# Altium project Orion_Board.PrjPcb
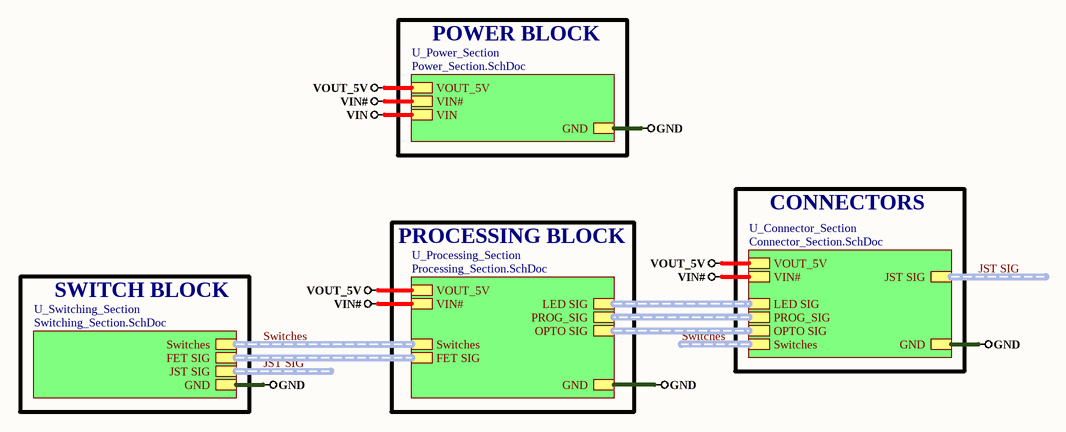
[diagram p0: Top_Sheet.SchDoc]
5 sheets, 64 parts. Net scope: hierarchical (ports join the sheet entries above them; power ports are global).
Board file: Orion_PCB.PcbDoc
Sheets:
  Top_Sheet.SchDoc
    U_Connector_Section = Connector_Section.SchDoc
    U_Processing_Section = Processing_Section.SchDoc
    U_Switching_Section = Switching_Section.SchDoc
    U_Power_Section = Power_Section.SchDoc

## Sheet Top_Sheet.SchDoc
size A4; DocumentNumber: 1; SheetNumber: 1; SheetTotal: 5

### Sub-sheets
U_Connector_Section = Connector_Section.SchDoc: VOUT_5V, GND, VIN#, PROG_SIG (harness PROG_SIG), LED SIG (harness LED SIG), Switches (harness Switches), OPTO SIG (harness OPTO SIG), JST SIG (harness JST SIG)
U_Power_Section = Power_Section.SchDoc: VOUT_5V, GND, VIN#, VIN
U_Processing_Section = Processing_Section.SchDoc: Switches (harness Switches), LED SIG (harness LED SIG), PROG_SIG (harness PROG_SIG), VOUT_5V, VIN#, FET SIG (harness FET SIG), OPTO SIG (harness OPTO SIG), GND
U_Switching_Section = Switching_Section.SchDoc: FET SIG (harness FET SIG), Switches (harness Switches), GND, JST SIG (harness JST SIG)

### Nets
GND: sheet U_Connector_Section/GND, sheet U_Processing_Section/GND, sheet U_Switching_Section/GND, sheet U_Power_Section/GND
VIN#: sheet U_Connector_Section/VIN#, sheet U_Processing_Section/VIN#, sheet U_Power_Section/VIN#
VOUT_5V: sheet U_Connector_Section/VOUT_5V, sheet U_Processing_Section/VOUT_5V, sheet U_Power_Section/VOUT_5V

### Buses and harness runs
harness JST SIG = sheet U_Connector_Section/JST SIG
harness JST SIG = sheet U_Switching_Section/JST SIG
harness sheet U_Connector_Section/LED SIG = sheet U_Processing_Section/LED SIG
harness sheet U_Connector_Section/OPTO SIG = sheet U_Processing_Section/OPTO SIG
harness sheet U_Connector_Section/PROG_SIG = sheet U_Processing_Section/PROG_SIG
harness sheet U_Processing_Section/FET SIG = sheet U_Switching_Section/FET SIG
harness Switches = sheet U_Connector_Section/Switches
harness Switches = sheet U_Processing_Section/Switches = sheet U_Switching_Section/Switches

### Notes on the sheet
- POWER BLOCK
- CONNECTORS
- PROCESSING BLOCK
- SWITCH BLOCK

## Sheet Connector_Section.SchDoc
size A4; DocumentNumber: 5; SheetNumber: 5; SheetTotal: 5
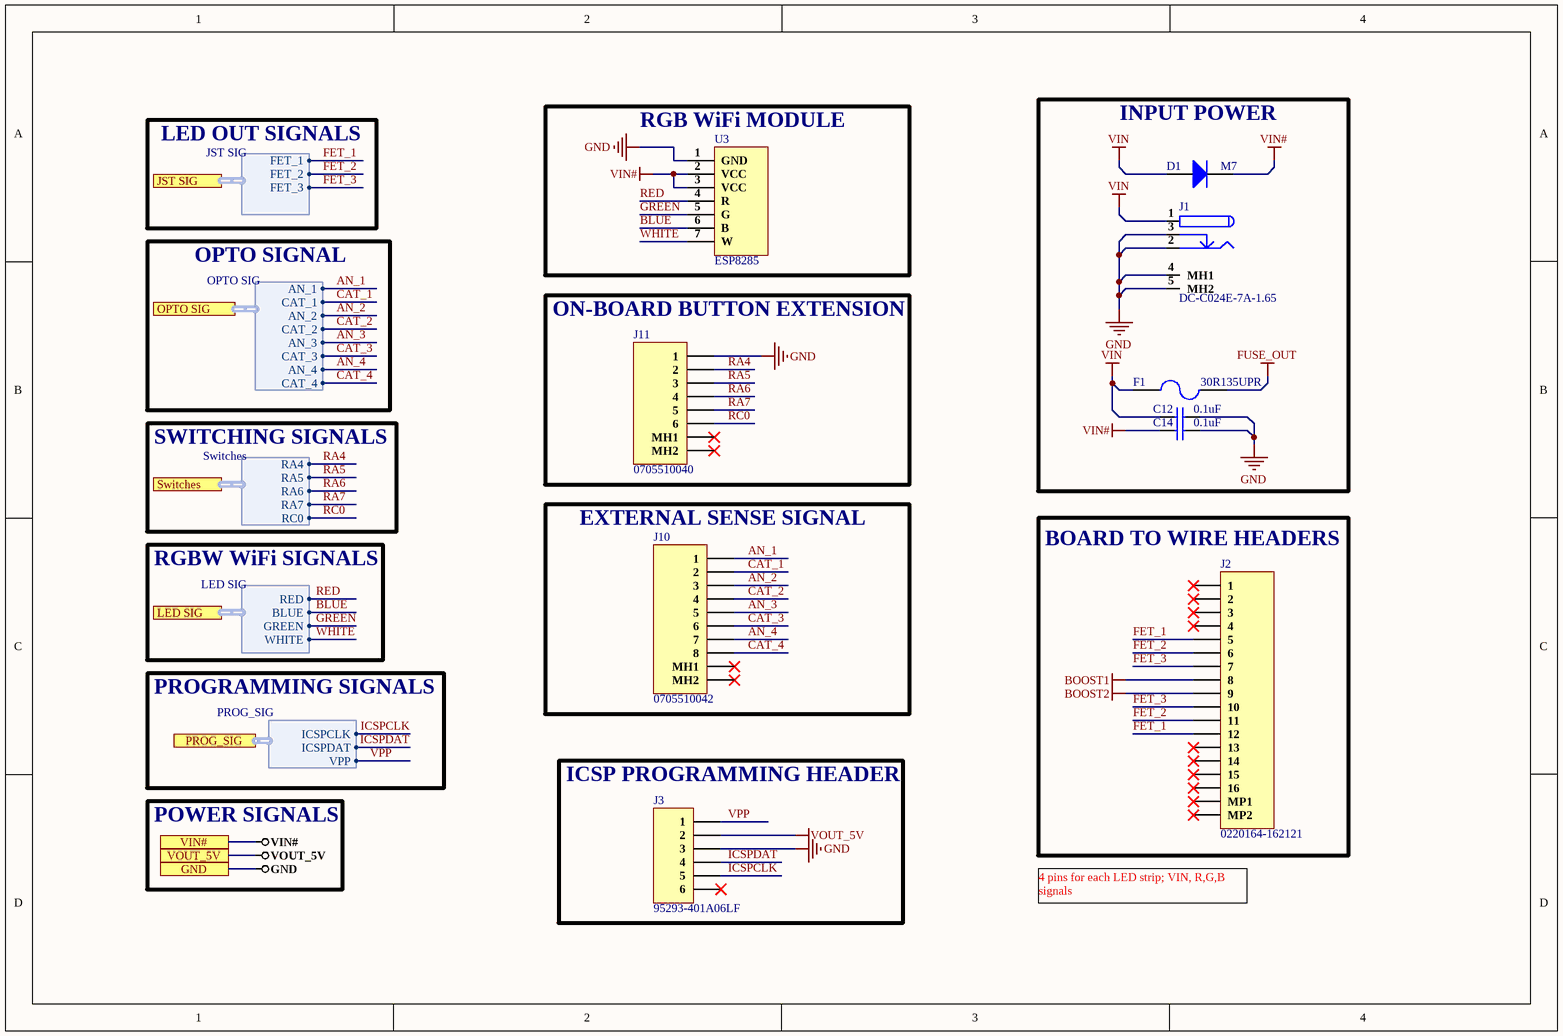
[diagram p1: Connector_Section.SchDoc]

### Parts
C12  0.1uF  [Cap0402]
C14  0.1uF  [Cap0402]
D1  M7  [SMA]
F1  30R135UPR  [30R135UPR]
J1  DC-C024E-7A-1.65  [DC-C024E-7A-1.65]
J2  0220164-162121  [0220164-162121]
J3  95293-401A06LF  [95293-401A06LF]
J10  0705510042  [0705510042]
J11  0705510040  [0705510040]
U3  ESP8285  [ESP8285]

### Blocks framed on the sheet
RGB WiFi MODULE: U3
INPUT POWER: C12 C14 D1 F1 J1
ON-BOARD BUTTON EXTENSION: J11
EXTERNAL SENSE SIGNAL: J10
BOARD TO WIRE HEADERS: J2
ICSP PROGRAMMING HEADER: J3

### Ports
GND, JST SIG (harness JST SIG), LED SIG (harness LED SIG), OPTO SIG (harness OPTO SIG), PROG_SIG (harness PROG_SIG), Switches (harness Switches), VIN#, VOUT_5V

### Harnesses
PROG_SIG: ICSPCLK, ICSPDAT, VPP
LED SIG: RED, BLUE, GREEN, WHITE
Switches: RA4, RA5, RA6, RA7, RC0
OPTO SIG: AN_1, CAT_1, AN_2, AN_3, AN_4, CAT_2, CAT_3, CAT_4
JST SIG: FET_1, FET_2, FET_3

### Nets
BOOST1: J2.8
BOOST2: J2.9
FUSE_OUT: F1.2
GND: C12.2 C14.2 J1.2 J1.3 J1.4(MH1) J1.5(MH2) J3.3 J11.1 U3.1(GND) ; port GND
VIN: C12.1 D1.1(A) F1.1 J1.1
VIN#: C14.1 D1.2(K) U3.2(VCC) U3.3(VCC) ; port VIN#
VOUT_5V: J3.2 ; port VOUT_5V
AN_1: J10.1 ; port OPTO SIG.AN_1
AN_2: J10.3 ; port OPTO SIG.AN_2
AN_3: J10.5 ; port OPTO SIG.AN_3
AN_4: J10.7 ; port OPTO SIG.AN_4
BLUE: U3.6(B) ; port LED SIG.BLUE
CAT_1: J10.2 ; port OPTO SIG.CAT_1
CAT_2: J10.4 ; port OPTO SIG.CAT_2
CAT_3: J10.6 ; port OPTO SIG.CAT_3
CAT_4: J10.8 ; port OPTO SIG.CAT_4
FET_1: J2.5 J2.12 ; port JST SIG.FET_1
FET_2: J2.6 J2.11 ; port JST SIG.FET_2
FET_3: J2.7 J2.10 ; port JST SIG.FET_3
GREEN: U3.5(G) ; port LED SIG.GREEN
ICSPCLK: J3.5 ; port PROG_SIG.ICSPCLK
ICSPDAT: J3.4 ; port PROG_SIG.ICSPDAT
RA4: J11.2 ; port Switches.RA4
RA5: J11.3 ; port Switches.RA5
RA6: J11.4 ; port Switches.RA6
RA7: J11.5 ; port Switches.RA7
RC0: J11.6 ; port Switches.RC0
RED: U3.4(R) ; port LED SIG.RED
VPP: J3.1 ; port PROG_SIG.VPP
WHITE: U3.7(W) ; port LED SIG.WHITE

Not connected (* = marked no-connect by the designer): J2 1* 2* 3* 4* 13* 14* 15* 16* MP1* MP2*; J3 6*; J10 MH1* MH2*; J11 MH1* MH2*

### Notes on the sheet
- LED OUT SIGNALS
- OPTO SIGNAL
- SWITCHING SIGNALS
- RGBW WiFi SIGNALS
- PROGRAMMING SIGNALS
- POWER SIGNALS
- 4 pins for each LED strip; VIN, R,G,B signals

### Library data of the parts
C12 C14 = C1005X5R1H104K050BB: CAP CER 0.1UF 50V X5R 0402; Manufacturer: TDK; Dielectric Material: Ceramic; Capacitance: 100nF; Tolerance: 10%; Supplier 1: Digi-Key; Manufacturer Part Number: C1005X5R1H104K050BB; Stock 1: 1455182; Pricing 1: 1=0.12, 10=0.09, 50=0.049, 100=0.04, 500=0.02858, 1000=0.02245, 2500=0.02041, 5000=0.01878 (USD); Mount: Surface Mount; Case/Package: 0402; Case Code (Metric): 1005; Case Code (Imperial): 0402; Weight: 2.3E-05oz; Min Operating Temperature: -55°C; Max Operating Temperature: 85°C; Dielectric: X5R; Voltage Rating: 50V; Packaging: Tape and Reel; Voltage Rating (DC): 50V; Termination: SMD/SMT; Construction: Flat; Package Quantity: 1; Resistor Type: Ceramic; Voltage: 50V; Series: C; Length: 1mm; Width: 0.02inch; Height: 0.5mm; Depth: 0.5mm; Thickness: 0.022inch; Radiation Hardening: No; Lead Free: Lead Free; REACH SVHC: No SVHC; RoHS Compliant: Yes; ComponentLink1URL: https://product.tdk.com/info/en/catalog/spec/mlccspec_commercial_general_midvoltage_en.pdf?src-supplier=Digi-Key; ComponentLink1Description: https://product.tdk.com/info/en/catalog/spec/mlccspec_commercial_general_midvoltage_en.pdf?src-supplier=Digi-Key; ComponentLink2URL: http://www.tdk.co.jp/tefe02/e413_c.pdf?src-supplier=Future+Electronics; ComponentLink2Description: http://www.tdk.co.jp/tefe02/e413_c.pdf?src-supplier=Future+Electronics; ComponentLink3URL: https://www.verical.com/server-webapp/html/getDatasheet?partID=743571&src-supplier=Verical; ComponentLink3Description: https://www.verical.com/server-webapp/html/getDatasheet?partID=743571&src-supplier=Verical; ComponentLink4URL: http://www.tdk.co.jp/tefe02/e412_c.pdf?src-supplier=Avnet+Europe; ComponentLink4Description: http://www.tdk.co.jp/tefe02/e412_c.pdf?src-supplier=Avnet+Europe; Supplier Part Number 1: 445-5942-1-ND
D1 = M7: 1A 5μA 1kV 1kV 1.1V 1A SMA(DO-214AC) Diodes - General Purpose ROHS; Manufacturer: Slkor; Value: Custom; Manufacturer Part No: M7; Package: SMA; ComponentLink1Description: LCSC; ComponentLink1URL: https://lcsc.com/product-detail/Diodes-General-Purpose_Slkor-SLKORMICRO-Elec-M7_C426571.html
F1 = 30R135UPR: PTC RESET FUSE 30V 1.35A RADIAL; Manufacturer: Littelfuse; Current Rating: 40A; Resistance: 130mR; Power Dissipation: 800mW; Trip Current: 2.7A; Time to Trip: 7.3s; Approvals: cULus,TUV; Supplier 1: Mouser; Manufacturer Part Number: 30R135UPR; RoHS: Yes; Category: PTC Resettable Fuses; Stock 1: 4973; Pricing 1: 1=0.53000, 10=0.42700, 50=0.42700, 100=0.32300, 1000=0.24200, 10000=0.23100 (USD); Case/Package: Radial; Min Operating Temperature: -40°C; Max Operating Temperature: 85°C; Package Quantity: 2000; Packaging: Tape and Reel; Max Current Rating: 40A; Termination: Radial; Max Voltage Rating (DC): 30V; Hold Current: 1.35A; Series: POLY-FUSE®, 30R; Width: 8.89mm; Height: 13.5mm; Lead Pitch: 5.1mm; Thickness: 3.05mm; Lead Free: Lead Free; RoHS Compliant: Yes; ComponentLink1URL: https://datasheet.ciiva.com/325/littelfuse-ptc-30r-325859.pdf?src-supplier=Digi-Key; ComponentLink1Description: https://datasheet.ciiva.com/325/littelfuse-ptc-30r-325859.pdf?src-supplier=Digi-Key; ComponentLink2URL: https://datasheet.ciiva.com/325/littelfuse-ptc-30r-325860.pdf?src-supplier=Digi-Key; ComponentLink2Description: https://datasheet.ciiva.com/325/littelfuse-ptc-30r-325860.pdf?src-supplier=Digi-Key; ComponentLink3URL: https://datasheet.ciiva.com/14119/gklittelfuse-30r-e-14119724.pdf?src-supplier=Distrelec; ComponentLink3Description: https://datasheet.ciiva.com/14119/gklittelfuse-30r-e-14119724.pdf?src-supplier=Distrelec; Supplier Part Number 1: 576-30R135UPR
J1 = DC-C024E-7A-1.65: DC Power Receptacle 1.65mm 4.3mm 7A 24V Plugin AC/DC Power Connectors ROHS; Manfacturer: XKB Connectivity; Maunfacturer Part No:: DC-C024E-7A-1.65; Package: Custom
J2 = 0220164-162121: 16 Pin Right angle JST Conn 2 mm Pitch; ComponentLink1Description: Datasheet; ComponentLink1URL: http://www.kaweei.com/indexdata/pic/2017072520595473499.pdf
J3 = 95293-401A06LF: CONN HEADER SMD 6POS 2.54MM; Manufacturer: Amphenol ICC / FCI; Number of Contacts: 6; Max Voltage Rating (AC): 1.5kV; Connector Type: Male Pin; Supplier 1: Digi-Key; Manufacturer Part Number: 95293-401A06LF; RoHS: Yes; Category: Headers and Wire Housings; Stock 1: 8979; Pricing 1: 1=3.32000, 10=3.01700, 100=2.65840 (USD); Mount: Surface Mount; Contact Plating: Tin; Color: Black; Contact Material: Bronze; Housing Color: Black; Housing Material: Thermoplastic; Min Operating Temperature: -65°C; Max Operating Temperature: 125°C; Number of Rows: 1; Termination: Solder; Package Quantity: 520; Packaging: Tape and Reel; Number of Positions: 6; Orientation: Straight; Series: BERGSTIK®, MezzSelect™, Basics+; Contact Type: Male Pin; Length: 15.24mm; Pitch: 2.54mm; Contact Mating Length: 0.23inch; Depth: 2.4mm; Radiation Hardening: No; Lead Free: Lead Free; RoHS Compliant: Yes; ComponentLink1URL: https://datasheet.ciiva.com/739/95293-739282.pdf?src-supplier=Digi-Key; ComponentLink1Description: https://datasheet.ciiva.com/739/95293-739282.pdf?src-supplier=Digi-Key; ComponentLink2URL: https://datasheet.ciiva.com/739/95293-739276.pdf?src-supplier=Digi-Key; ComponentLink2Description: https://datasheet.ciiva.com/739/95293-739276.pdf?src-supplier=Digi-Key; ComponentLink3URL: https://datasheet.ciiva.com/739/95293-739268.pdf?src-supplier=Digi-Key; ComponentLink3Description: https://datasheet.ciiva.com/739/95293-739268.pdf?src-supplier=Digi-Key; ComponentLink4URL: https://datasheet.ciiva.com/16733/95293-16733007.pdf?src-supplier=Avnet+Europe; ComponentLink4Description: https://datasheet.ciiva.com/16733/95293-16733007.pdf?src-supplier=Avnet+Europe; Supplier Part Number 1: 609-4398-1-ND
J10 = 0705510042: Conn Shrouded Header HDR 8 POS 2.54mm Solder RA Thru-Hole SL™ Tube; Manufacturer: Molex; Number of Positions: 8; Connector Type: Male Pin; Contact Resistance: 15mR; Pitch: 0.1inch; Supplier 1: Digi-Key; Manufacturer Part Number: 0705510042; RoHS: Yes; Category: Headers and Wire Housings; Pricing 1: 1=2.63000, 10=2.31400, 100=1.84100, 1000=1.52539, 5000=1.36759 (USD); Mount: Through Hole; Contact Plating: Gold; Color: Black; Housing Material: Polyester; Contact Material: Copper Alloy; Housing Color: Black; Min Operating Temperature: -40°C; Max Operating Temperature: 105°C; Number of Rows: 1; Packaging: Rail/Tube; Fastening Type: Latch; Termination: Solder; Orientation: Right Angle; Contact Mating Length: 0.24inch; Depth: 13.59mm; ComponentLink1URL: http://components.arrow.com/part/dataview/2934385S6164661N3303?src-supplier=Arrow+Electronics; ComponentLink1Description: http://components.arrow.com/part/dataview/2934385S6164661N3303?src-supplier=Arrow+Electronics; ComponentLink2URL: http://www.molex.com/pdm_docs/sd/705510001_sd.pdf?src-supplier=Digi-Key; ComponentLink2Description: http://www.molex.com/pdm_docs/sd/705510001_sd.pdf?src-supplier=Digi-Key; Supplier Part Number 1: WM20418-ND
J11 = 0705510040: CONN HEADER R/A 6POS 2.54MM; Manufacturer: Molex; Number of Positions: 6; Contact Resistance: 15mR; Connector Type: Male Pin; Supplier 1: Digi-Key; Manufacturer Part Number: 0705510040; RoHS: Yes; Category: Headers and Wire Housings; Stock 1: 1707; Pricing 1: 1=2.52000, 28=2.14929, 84=1.77560, 952=1.40175, 4900=1.24600 (USD); Mount: Through Hole; Contact Plating: Gold; Color: Black; Contact Material: Copper Alloy; Housing Material: Polyester; Housing Color: Black; Min Operating Temperature: -40°C; Max Operating Temperature: 105°C; Number of Rows: 1; Packaging: Rail/Tube; Termination: Solder; Number of Contacts: 6; Package Quantity: 1120; Fastening Type: Latch; Orientation: Right Angle; Pitch: 2.54mm; Contact Mating Length: 0.24inch; Depth: 13.59mm; Radiation Hardening: No; ComponentLink1URL: http://components.arrow.com/part/dataview/2934387S8722778N3303?src-supplier=Arrow+Electronics; ComponentLink1Description: http://components.arrow.com/part/dataview/2934387S8722778N3303?src-supplier=Arrow+Electronics; ComponentLink2URL: https://www.molex.com/pdm_docs/sd/705510001_sd.pdf?src-supplier=Digi-Key; ComponentLink2Description: https://www.molex.com/pdm_docs/sd/705510001_sd.pdf?src-supplier=Digi-Key; Supplier Part Number 1: WM21002-ND
U3 = ESP8285: DC5-24V Wireless WIFI LED RGB Controller RGBW Controller IR / RF Remote Control IOS/Android for LED Strip RGB RGBW RGBWW; Manufacturer: Tasmota; ComponentLink1Description: Supplier Link; ComponentLink1URL: https://tasmota.github.io/docs/devices/MagicHome-with-ESP8285/#; Manufacturer Part No: ESP8285; Package: Custom

## Sheet Processing_Section.SchDoc
size A4; DocumentNumber: 3; SheetNumber: 3; SheetTotal: 5
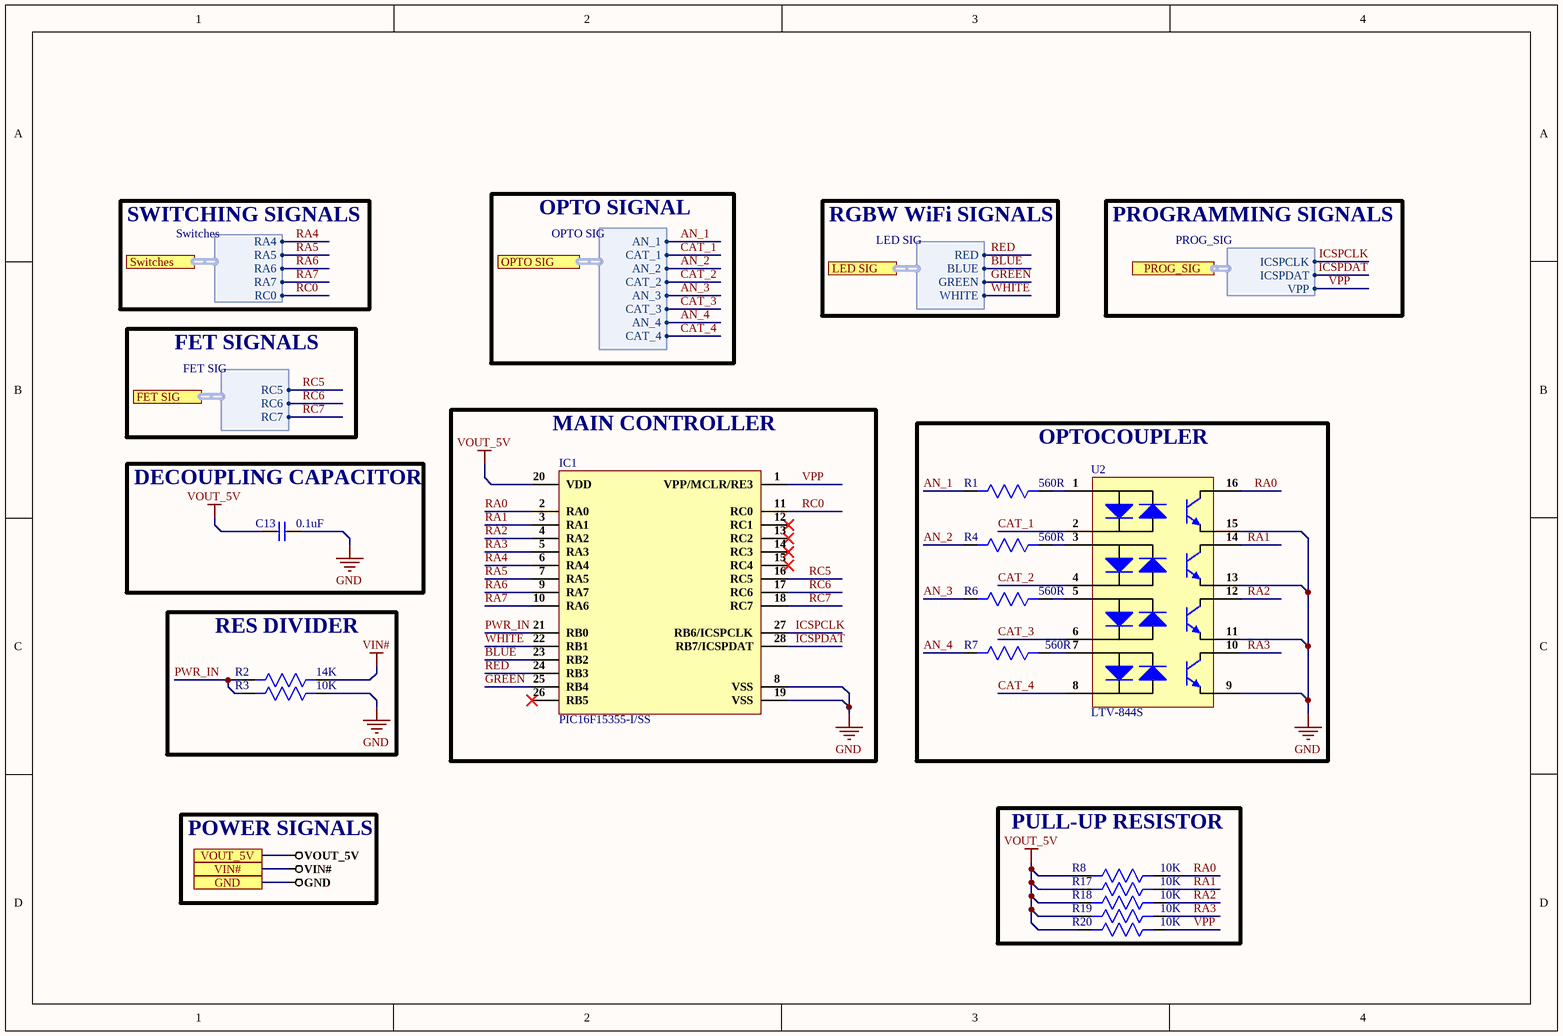
[diagram p2: Processing_Section.SchDoc]

### Parts
C13  0.1uF  [CAP 0201]
IC1  PIC16F15355-I/SS  [PIC16F15355-I/SS]
R1  560R  [RES 1210]
R2  14K  [Res0603]
R3  10K  [RES 0805]
R4  560R  [RES 1210]
R6  560R  [RES 1210]
R7  560R  [RES 1210]
R8  10K  [RES 0805]
R17  10K  [RES 0805]
R18  10K  [RES 0805]
R19  10K  [RES 0805]
R20  10K  [RES 0805]
U2  LTV-844S  [LTV-844S]

### Blocks framed on the sheet
MAIN CONTROLLER: IC1
OPTOCOUPLER: R1 R4 R6 R7 U2
DECOUPLING CAPACITOR: C13
RES DIVIDER: R2 R3
PULL-UP RESISTOR: R8 R17-R20

### Ports
FET SIG (harness FET SIG), GND, LED SIG (harness LED SIG), OPTO SIG (harness OPTO SIG), PROG_SIG (harness PROG_SIG), Switches (harness Switches), VIN#, VOUT_5V

### Harnesses
LED SIG: RED, BLUE, GREEN, WHITE
PROG_SIG: ICSPCLK, ICSPDAT, VPP
OPTO SIG: AN_1, CAT_1, AN_2, AN_3, AN_4, CAT_2, CAT_3, CAT_4
Switches: RA4, RA5, RA6, RA7, RC0
FET SIG: RC5, RC6, RC7

### Nets
GND: C13.2 IC1.8(VSS) IC1.19(VSS) R3.2 U2.9(E) U2.11(E) U2.13(E) U2.15(E) ; port GND
VIN#: R2.2 ; port VIN#
VOUT_5V: C13.1 IC1.20(VDD) R8.1 R17.1 R18.1 R19.1 R20.1 ; port VOUT_5V
AN_1: R1.1 ; port OPTO SIG.AN_1
AN_2: R4.1 ; port OPTO SIG.AN_2
AN_3: R6.1 ; port OPTO SIG.AN_3
AN_4: R7.1 ; port OPTO SIG.AN_4
BLUE: IC1.23(RB2) ; port LED SIG.BLUE
CAT_1: U2.2(K,A) ; port OPTO SIG.CAT_1
CAT_2: U2.4(K,A) ; port OPTO SIG.CAT_2
CAT_3: U2.6(K,A) ; port OPTO SIG.CAT_3
CAT_4: U2.8(K,A) ; port OPTO SIG.CAT_4
GREEN: IC1.25(RB4) ; port LED SIG.GREEN
ICSPCLK: IC1.27(RB6/ICSPCLK) ; port PROG_SIG.ICSPCLK
ICSPDAT: IC1.28(RB7/ICSPDAT) ; port PROG_SIG.ICSPDAT
PWR_IN: IC1.21(RB0) R2.1 R3.1
RA0: IC1.2(RA0) R8.2 U2.16(C)
RA1: IC1.3(RA1) R17.2 U2.14(C)
RA2: IC1.4(RA2) R18.2 U2.12(C)
RA3: IC1.5(RA3) R19.2 U2.10(C)
RA4: IC1.6(RA4) ; port Switches.RA4
RA5: IC1.7(RA5) ; port Switches.RA5
RA6: IC1.9(RA7) ; port Switches.RA6
RA7: IC1.10(RA6) ; port Switches.RA7
RC0: IC1.11(RC0) ; port Switches.RC0
RC5: IC1.16(RC5) ; port FET SIG.RC5
RC6: IC1.17(RC6) ; port FET SIG.RC6
RC7: IC1.18(RC7) ; port FET SIG.RC7
RED: IC1.24(RB3) ; port LED SIG.RED
VPP: IC1.1(VPP/MCLR/RE3) R20.2 ; port PROG_SIG.VPP
WHITE: IC1.22(RB1) ; port LED SIG.WHITE
NetR1_2: R1.2 U2.1(A,K)
NetR4_2: R4.2 U2.3(A,K)
NetR6_2: R6.2 U2.5(A,K)
NetR7_2: R7.2 U2.7(A,K)

Not connected (* = marked no-connect by the designer): IC1 12(RC1)* 13(RC2)* 14(RC3)* 15(RC4)* 26(RB5)*

### Notes on the sheet
- SWITCHING SIGNALS
- OPTO SIGNAL
- RGBW WiFi SIGNALS
- PROGRAMMING SIGNALS
- FET SIGNALS
- POWER SIGNALS

### Library data of the parts
C13 = GRM033R61E104KE14D: CAP CER 0.1UF 25V X5R 0201; Manufacturer: Murata; Capacitance: 100nF; Tolerance: 10%; Supplier 1: Mouser; Manufacturer Part Number: GRM033R61E104KE14D; RoHS: Yes; Category: Ceramic Capacitors; Stock 1: 19728; Pricing 1: 1=0.12000, 10=0.05600, 50=0.05600, 100=0.02500, 1000=0.01400, 10000=0.01100 (USD); Mount: Surface Mount; Case/Package: 0201; Case Code (Metric): 0603; Case Code (Imperial): 0201; Weight: 1.2E-05oz; Min Operating Temperature: -55°C; Max Operating Temperature: 85°C; Packaging: Tape and Reel; Voltage Rating: 25V; Dielectric: X5R; Termination: SMD/SMT; Resistor Type: Ceramic; Voltage Rating (DC): 25V; Package Quantity: 15000; Length: 0.024inch; Width: 0.012inch; Height: 0.3mm; Thickness: 0.013inch; Lead Free: Lead Free; RoHS Compliant: Yes; ComponentLink1URL: http://www.farnell.com/datasheets/2867843.pdf?src-supplier=Farnell; ComponentLink1Description: http://www.farnell.com/datasheets/2867843.pdf?src-supplier=Farnell; ComponentLink2URL: http://www.mouser.com/ds/2/281/c02e-2905.pdf?src-supplier=Mouser; ComponentLink2Description: http://www.mouser.com/ds/2/281/c02e-2905.pdf?src-supplier=Mouser; ComponentLink3URL: http://search.murata.co.jp/Ceramy/image/img/A01X/G101/ENG/GRM033R61E104KE14-01.pdf?src-supplier=Digi-Key; ComponentLink3Description: http://search.murata.co.jp/Ceramy/image/img/A01X/G101/ENG/GRM033R61E104KE14-01.pdf?src-supplier=Digi-Key; ComponentLink4URL: http://www.farnell.com/datasheets/2867843.pdf?src-supplier=Newark; ComponentLink4Description: http://www.farnell.com/datasheets/2867843.pdf?src-supplier=Newark; Supplier Part Number 1: 81-GRM033R61E104KE4D
IC1 = PIC16F15355-I/SS: IC MCU 8BIT 14KB FLASH 28SSOP; Manufacturer: Microchip; Interface: I2C,SPI,UART,USART; Peripherals: Brown-out Detect/Reset,POR,PWM,WDT; Core Architecture: PIC; Frequency: 32MHz; Number of I/Os: 25; Oscillator Type: Internal; Supplier 1: Digi-Key; Manufacturer Part Number: PIC16F15355-I/SS; RoHS: Yes; Category: Microcontrollers; Stock 1: 36; Pricing 1: 1=1.39000, 25=1.27640, 100=1.15500 (USD); Case/Package: SSOP; Min Operating Temperature: -40°C; Max Operating Temperature: 85°C; Memory Type: FLASH; Packaging: Rail/Tube; Memory Size: 14KB; RoHS Compliant: Yes; ComponentLink1URL: http://www.microchip.com/mymicrochip/filehandler.aspx?ddocname=en585524&src-supplier=Digi-Key; ComponentLink1Description: http://www.microchip.com/mymicrochip/filehandler.aspx?ddocname=en585524&src-supplier=Digi-Key; Supplier Part Number 1: PIC16F15355-I/SS-ND
R1 R4 R6 R7 = RC1210FR-07560RL: RES 560 OHM 1% 1/2W 1210; Manufacturer: Yageo; Power Rating: 500mW; Voltage Rating: 200V; Temperature Coefficient: 100ppm/°C; Supplier 1: Digi-Key; Manufacturer Part Number: RC1210FR-07560RL; RoHS: Yes; Category: Chip SMD Resistors; Pricing 1: 1=0.17000, 10=0.14900, 100=0.05740, 1000=0.02525, 2500=0.02181 (USD); Case/Package: 1210; Case Code (Imperial): 1210; Case Code (Metric): 3225; Size Code: 1210; Min Operating Temperature: -55°C; Max Operating Temperature: 155°C; Tolerance: 1%; Packaging: Tape and Reel; Resistance: 560R; Resistor Type: Thick Film; Termination: SMD/SMT; Number of Terminations: 2; Max Power Dissipation: 500mW; Features: Moisture Resistant; Series: RC; Construction: Rectangular; Length: 3.1mm; Width: 2.6mm; Height: 0.024inch; Depth: 2.6mm; Military Standard: Not; Lead Free: Lead Free; RoHS Compliant: Yes; ComponentLink1URL: https://datasheet.ciiva.com/12575/pyu-rc1210-51-rohs-l-4-12575621.pdf?src-supplier=Mouser; ComponentLink1Description: https://datasheet.ciiva.com/12575/pyu-rc1210-51-rohs-l-4-12575621.pdf?src-supplier=Mouser; Supplier Part Number 1: 13-RC1210FR-07560RLCT-ND
R2 = RT0603BRE0714KL: RES SMD 0603 14kOhm 0.1% Paper T/R; Manufacturer: Yageo; Resistance: 14kR; Power Rating: 100mW; Voltage Rating (DC): 50V; Temperature Coefficient: 50ppm/°C; Supplier 1: Digi-Key; Manufacturer Part Number: RT0603BRE0714KL; RoHS: Yes; Category: Chip SMD Resistors; Pricing 1: 5000=0.04543 (USD); Case/Package: 0603; Min Operating Temperature: -55°C; Max Operating Temperature: 155°C; Tolerance: 0.1%; Packaging: Tape and Reel; Resistor Type: Thin Film; Series: RT; Max Power Dissipation: 100mW; Number of Terminations: 2; Construction: Rectangular; Length: 1.6mm; Width: 800um; Depth: 0.8mm; Military Standard: Not; Lead Free: Lead Free; RoHS Compliant: Yes; ComponentLink1URL: http://components.arrow.com/part/dataview/0323_03292491?src-supplier=Arrow+Europe; ComponentLink1Description: http://components.arrow.com/part/dataview/0323_03292491?src-supplier=Arrow+Europe; ComponentLink2URL: http://www.yageo.com/documents/recent/PYu-RT_1-to-0.01_RoHS_L_9.pdf?src-supplier=Digi-Key; ComponentLink2Description: http://www.yageo.com/documents/recent/PYu-RT_1-to-0.01_RoHS_L_9.pdf?src-supplier=Digi-Key; Supplier Part Number 1: RT0603BRE0714KL-ND
R3 R8 R17-R20 = 0805W8F1002T5E: ±1% 1/8W Thick Film Resistors 150V ±100ppm/℃ -55℃~+155℃ 10kΩ 0805 Chip Resistor - Surface Mount ROHS; Manufacturer: UNI-ROYAL; Manufacturer Part No: 0805W8F1002T5E; Package: 0805; Value: 10kΩ
U2 = LTV-844S: OPTOISOLTR 5KV 4CH TRANS 16-SMD; Manufacturer: Vishay Lite-On; Forward Voltage: 1.4V; Number of Channels: 4; Collector Emitter Voltage (VCEO): 35V; Rise Time: 18000ns; Forward Current: 50mA; Collector Emitter Saturation Voltage: 200mV; Current Transfer Ratio: 300%; Max Power Dissipation: 200mW; Input Type: AC; Supplier 1: Future Electronics; Manufacturer Part Number: LTV-844S; RoHS: Yes; Category: Optocouplers; Stock 1: 1400; Pricing 1: 25=0.90500 (USD); Mount: Surface Mount; Case/Package: SMD/SMT; Number of Pins: 16; Min Operating Temperature: -30°C; Max Operating Temperature: 100°C; Packaging: Rail/Tube; Max Output Voltage: 35V; Output Current per Channel: 50mA; Fall Time: 18000ns; Number of Elements: 4; Power Dissipation: 200mW; Isolation Voltage: 5kV; Max Input Current: 50mA; Max Collector Current: 50mA; Package Quantity: 25; Series: -; Collector-emitter Voltage-Max: 200mV; Number of Circuits: 4; Output Voltage: 35V; Isolation Voltage-Max: 5kV; Radiation Hardening: No; RoHS Compliant: Yes; Lead Free: Lead Free; ComponentLink1URL: https://datasheet.ciiva.com/11772/0900766b80de6b5f-11772471.pdf?src-supplier=RSComponents; ComponentLink1Description: https://datasheet.ciiva.com/11772/0900766b80de6b5f-11772471.pdf?src-supplier=RSComponents; ComponentLink2URL: https://datasheet.ciiva.com/15118/getdatasheetpartid-141775-15118788.pdf?src-supplier=Verical; ComponentLink2Description: https://datasheet.ciiva.com/15118/getdatasheetpartid-141775-15118788.pdf?src-supplier=Verical; ComponentLink3URL: https://datasheet.ciiva.com/2086/s-110-ltv-814824844m-s-s-ta-s-ta1-s-tpseries-2086434.pdf?src-supplier=Digi-Key; ComponentLink3Description: https://datasheet.ciiva.com/2086/s-110-ltv-814824844m-s-s-ta-s-ta1-s-tpseries-2086434.pdf?src-supplier=Digi-Key; ComponentLink4URL: https://datasheet.ciiva.com/15957/ltv-8x4-15957686.pdf?src-supplier=Onlinecomponents.com; ComponentLink4Description: https://datasheet.ciiva.com/15957/ltv-8x4-15957686.pdf?src-supplier=Onlinecomponents.com; ComponentLink5URL: https://datasheet.ciiva.com/26923/getdatasheetpartid-757770-26923467.pdf?src-supplier=Verical; ComponentLink5Description: https://datasheet.ciiva.com/26923/getdatasheetpartid-757770-26923467.pdf?src-supplier=Verical; Supplier Part Number 1: 5600457

## Sheet Switching_Section.SchDoc
size A4; DocumentNumber: 4; SheetNumber: 4; SheetTotal: 5
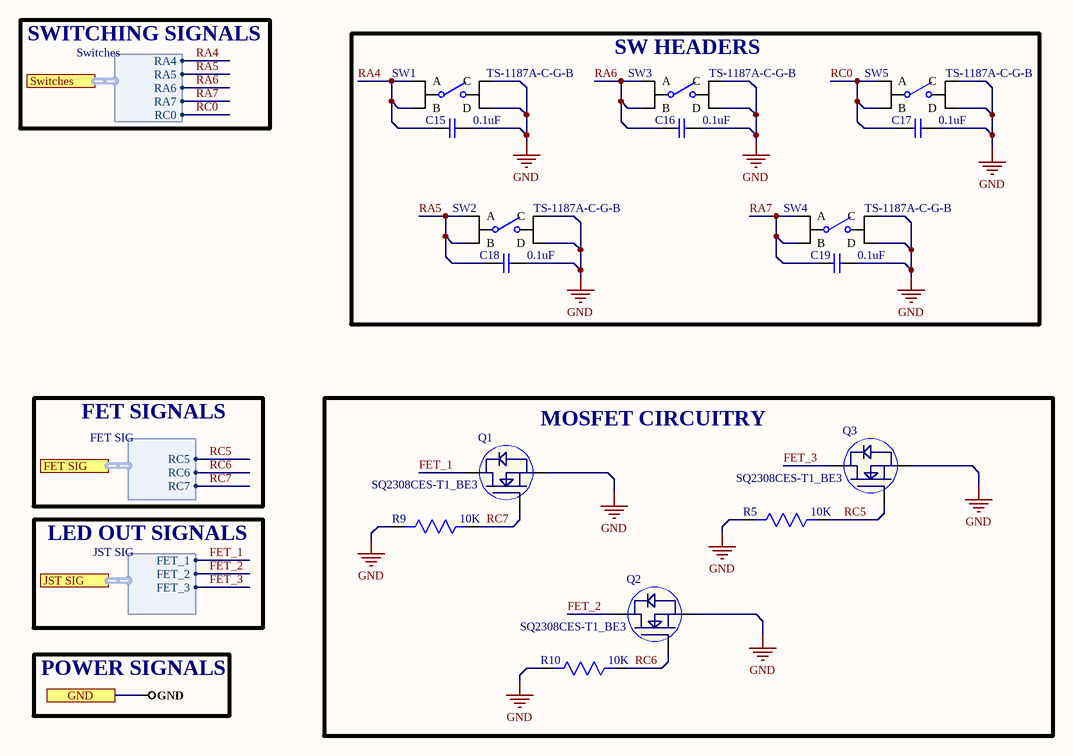
[diagram p3: Switching_Section.SchDoc]

### Parts
C15  0.1uF  [CAP 0201]
C16  0.1uF  [CAP 0201]
C17  0.1uF  [CAP 0201]
C18  0.1uF  [CAP 0201]
C19  0.1uF  [CAP 0201]
Q1  SQ2308CES-T1_BE3  [SQ2308CES-T1_BE3]
Q2  SQ2308CES-T1_BE3  [SQ2308CES-T1_BE3]
Q3  SQ2308CES-T1_BE3  [SQ2308CES-T1_BE3]
R5  10K  [RES 0805]
R9  10K  [RES 0805]
R10  10K  [RES 0805]
SW1  TS-1187A-C-G-B  [TS-1187A-C-G-B]
SW2  TS-1187A-C-G-B  [TS-1187A-C-G-B]
SW3  TS-1187A-C-G-B  [TS-1187A-C-G-B]
SW4  TS-1187A-C-G-B  [TS-1187A-C-G-B]
SW5  TS-1187A-C-G-B  [TS-1187A-C-G-B]

### Blocks framed on the sheet
SW HEADERS: C15-C19 SW1-SW5
MOSFET CIRCUITRY: Q1-Q3 R5 R9 R10

### Ports
FET SIG (harness FET SIG), GND, JST SIG (harness JST SIG), Switches (harness Switches)

### Harnesses
FET SIG: RC5, RC6, RC7
Switches: RA4, RA5, RA6, RA7, RC0
JST SIG: FET_1, FET_2, FET_3

### Nets
GND: C15.2 C16.2 C17.2 C18.2 C19.2 Q1.2(S) Q2.2(S) Q3.2(S) R5.1 R9.1 R10.1 SW1.3(C) SW1.4(D) SW2.3(C) SW2.4(D) SW3.3(C) SW3.4(D) SW4.3(C) SW4.4(D) SW5.3(C) SW5.4(D) ; port GND
FET_1: Q1.3(D) ; port JST SIG.FET_1
FET_2: Q2.3(D) ; port JST SIG.FET_2
FET_3: Q3.3(D) ; port JST SIG.FET_3
RA4: C15.1 SW1.1(A) SW1.2(B) ; port Switches.RA4
RA5: C18.1 SW2.1(A) SW2.2(B) ; port Switches.RA5
RA6: C16.1 SW3.1(A) SW3.2(B) ; port Switches.RA6
RA7: C19.1 SW4.1(A) SW4.2(B) ; port Switches.RA7
RC0: C17.1 SW5.1(A) SW5.2(B) ; port Switches.RC0
RC5: Q3.1(G) R5.2 ; port FET SIG.RC5
RC6: Q2.1(G) R10.2 ; port FET SIG.RC6
RC7: Q1.1(G) R9.2 ; port FET SIG.RC7

### Notes on the sheet
- SWITCHING SIGNALS
- FET SIGNALS
- LED OUT SIGNALS
- POWER SIGNALS

### Library data of the parts
C15-C19 = GRM033R61E104KE14D: as C13 on sheet Processing_Section; Supplier 1: Mouser; Manufacturer Part Number: GRM033R61E104KE14D; RoHS: Yes; Category: Ceramic Capacitors; Stock 1: 19728; Pricing 1: 1=0.12000, 10=0.05600, 50=0.05600, 100=0.02500, 1000=0.01400, 10000=0.01100 (USD); Mount: Surface Mount; Case/Package: 0201; Case Code (Metric): 0603; Case Code (Imperial): 0201; Weight: 1.2E-05oz; Min Operating Temperature: -55°C; Max Operating Temperature: 85°C; Packaging: Tape and Reel; Voltage Rating: 25V; Dielectric: X5R; Termination: SMD/SMT; Resistor Type: Ceramic; Voltage Rating (DC): 25V; Package Quantity: 15000; Length: 0.024inch; Width: 0.012inch; Height: 0.3mm; Thickness: 0.013inch; Lead Free: Lead Free; RoHS Compliant: Yes; ComponentLink1URL: http://www.farnell.com/datasheets/2867843.pdf?src-supplier=Farnell; ComponentLink1Description: http://www.farnell.com/datasheets/2867843.pdf?src-supplier=Farnell; ComponentLink2URL: http://www.mouser.com/ds/2/281/c02e-2905.pdf?src-supplier=Mouser; ComponentLink2Description: http://www.mouser.com/ds/2/281/c02e-2905.pdf?src-supplier=Mouser; ComponentLink3URL: http://search.murata.co.jp/Ceramy/image/img/A01X/G101/ENG/GRM033R61E104KE14-01.pdf?src-supplier=Digi-Key; ComponentLink3Description: http://search.murata.co.jp/Ceramy/image/img/A01X/G101/ENG/GRM033R61E104KE14-01.pdf?src-supplier=Digi-Key; ComponentLink4URL: http://www.farnell.com/datasheets/2867843.pdf?src-supplier=Newark; ComponentLink4Description: http://www.farnell.com/datasheets/2867843.pdf?src-supplier=Newark; Supplier Part Number 1: 81-GRM033R61E104KE4D
Q1-Q3 = SQ2308CES-T1_BE3: MOSFET N-CHANNEL 60V (D-S); Manufacturer: Vishay; Supplier 1: Avnet; Manufacturer Part Number: SQ2308CES-T1_BE3; RoHS: No; Stock 1: 2862; Pricing 1: 1=0.64000, 25=0.50800, 50=0.45700, 100=0.40600, 250=0.36300, 500=0.31900 (USD); Supplier Part Number 1: 80AH8959
R5 R9 R10 = 0805W8F1002T5E: as R3 on sheet Processing_Section; Manufacturer Part No: 0805W8F1002T5E; Package: 0805; Value: 10kΩ
SW1-SW5 = TS-1187A-C-G-B: 5.1mm 3.5mm Round Button 50mA To 5.1mm SPST 12V SMD Tactile Switche; Manufacturer: XKB; Manufacturer Part No: TS-1187A-C-G-B; Package: Custom; ComponentLink1Description: LCSC; ComponentLink1URL: https://lcsc.com/product-detail/Tactile-Switches_XKB-Enterprise-TS-1187A-C-G-A_C318886.html

## Sheet Power_Section.SchDoc
size A4; DocumentNumber: 2; SheetNumber: 2; SheetTotal: 5
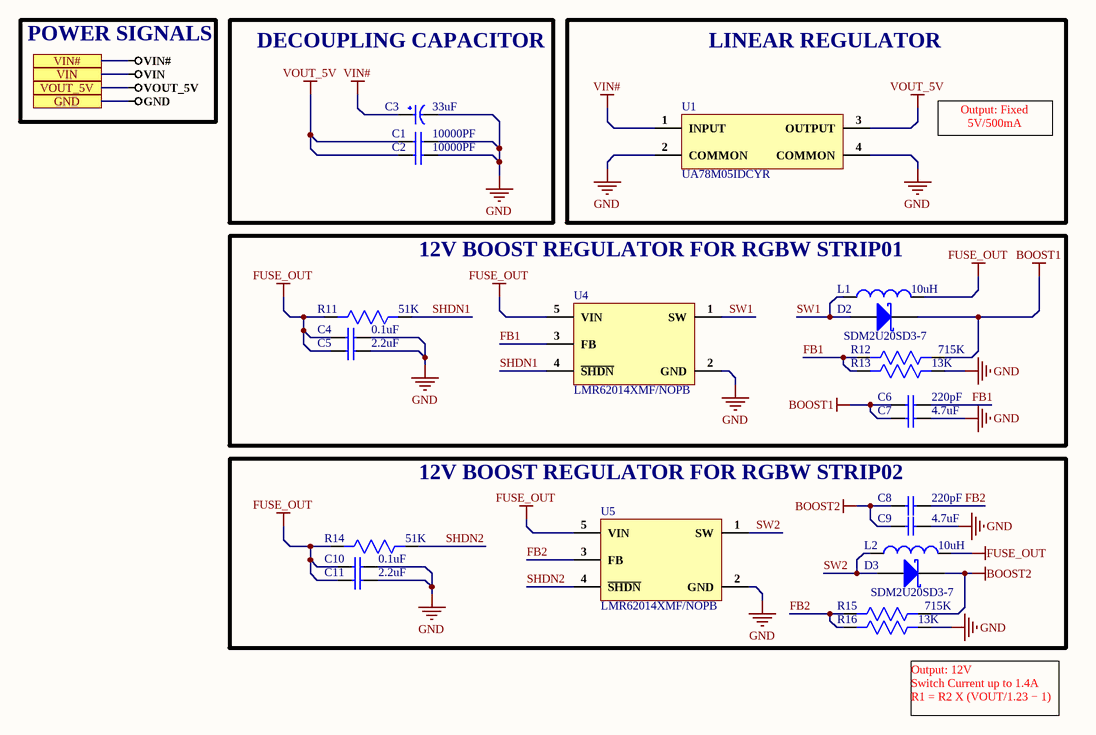
[diagram p4: Power_Section.SchDoc]

### Parts
C1  10000PF  [Cap1206]
C2  10000PF  [Cap1206]
C3  33uF  [EEE-HB1E330AP]
C4  0.1uF  [CAP 0201]
C5  2.2uF  [Cap0402]
C6  220pF  [CAP 0201]
C7  4.7uF  [Cap0603]
C8  220pF  [CAP 0201]
C9  4.7uF  [Cap0603]
C10  0.1uF  [CAP 0201]
C11  2.2uF  [Cap0402]
D2  SDM2U20SD3-7  [SDM2U20SD3-7]
D3  SDM2U20SD3-7  [SDM2U20SD3-7]
L1  10uH  [SPM5012T-100M-LR]
L2  10uH  [SPM5012T-100M-LR]
R11  51K  [Res-0201]
R12  715K  [Res-0201]
R13  13K  [Res-0201]
R14  51K  [Res-0201]
R15  715K  [Res-0201]
R16  13K  [Res-0201]
U1  UA78M05IDCYR  [UA78M05IDCYR]
U4  LMR62014XMF/NOPB  [SOT23-5]
U5  LMR62014XMF/NOPB  [SOT23-5]

### Blocks framed on the sheet
DECOUPLING CAPACITOR: C1-C3
LINEAR REGULATOR: U1
12V BOOST REGULATOR FOR RGBW STRIP01: C4-C7 D2 L1 R11-R13 U4
12V BOOST REGULATOR FOR RGBW STRIP02: C8-C11 D3 L2 R14-R16 U5

### Ports
GND, VIN, VIN#, VOUT_5V

### Nets
BOOST1: C6.1 C7.1 D2.2(K) R12.2
BOOST2: C8.1 C9.1 D3.2(K) R15.2
FUSE_OUT: C4.1 C5.1 C10.1 C11.1 L1.2 L2.2 R11.1 R14.1 U4.5(VIN) U5.5(VIN)
GND: C1.2 C2.2 C3.2 C4.2 C5.2 C7.2 C9.2 C10.2 C11.2 R13.2 R16.2 U1.2(COMMON) U1.4(COMMON) U4.2(GND) U5.2(GND) ; port GND
VIN#: C3.1 U1.1(INPUT) ; port VIN#
VOUT_5V: C1.1 C2.1 U1.3(OUTPUT) ; port VOUT_5V
FB1: C6.2 R12.1 R13.1 U4.3(FB)
FB2: C8.2 R15.1 R16.1 U5.3(FB)
SHDN1: R11.2 U4.4(~{SH}~{DN})
SHDN2: R14.2 U5.4(~{SH}~{DN})
SW1: D2.1(A) L1.1 U4.1(SW)
SW2: D3.1(A) L2.1 U5.1(SW)

### Notes on the sheet
- POWER SIGNALS
- Output: Fixed 5V/500mA
- Output: 12V
  Switch Current up to 1.4A
  R1 = R2 X (VOUT/1.23 − 1)

### Library data of the parts
C1 C2 = CC1206KRX7R0BB103: CAP CER 10000PF 100V X7R 1206; Manufacturer: Yageo; Capacitance: 10nF; Tolerance: 10%; Dissipation Factor: 2.5%; Insulation Resistance: 10GR; Supplier 1: Digi-Key; Manufacturer Part Number: CC1206KRX7R0BB103; RoHS: Yes; Category: Ceramic Capacitors; Stock 1: 7045; Pricing 1: 1=0.28000, 10=0.18900, 50=0.11320, 100=0.09560, 500=0.06542, 1000=0.05787 (USD); Mount: Surface Mount; Case/Package: 1206; Number of Pins: 2; Case Code (Imperial): 1206; Case Code (Metric): 3216; Min Operating Temperature: -55°C; Max Operating Temperature: 125°C; Dielectric: X7R; Voltage: 100V; Series: CC; Voltage Rating: 100V; Voltage Rating (DC): 100V; Packaging: Tape and Reel; Package Quantity: 4000; Termination: SMD/SMT; Resistor Type: Ceramic; Length: 3.2mm; Width: 1.6mm; Height: 0.85mm; Depth: 1.6mm; Thickness: 0.057inch; Radiation Hardening: No; Lead Free: Lead Free; RoHS Compliant: Yes; ComponentLink1URL: https://datasheet.ciiva.com/15375/upy-gp-np0-16v-to-50v-8-15375877.pdf?src-supplier=Mouser; ComponentLink1Description: https://datasheet.ciiva.com/15375/upy-gp-np0-16v-to-50v-8-15375877.pdf?src-supplier=Mouser; ComponentLink2URL: https://datasheet.ciiva.com/16744/upy-np0x7r-mv-100-to-630v-9-16744582.pdf?src-supplier=Future+Electronics; ComponentLink2Description: https://datasheet.ciiva.com/16744/upy-np0x7r-mv-100-to-630v-9-16744582.pdf?src-supplier=Future+Electronics; ComponentLink3URL: https://datasheet.ciiva.com/15189/getdatasheetpartid-315568-15189269.pdf?src-supplier=Verical; ComponentLink3Description: https://datasheet.ciiva.com/15189/getdatasheetpartid-315568-15189269.pdf?src-supplier=Verical; ComponentLink4URL: https://datasheet.ciiva.com/16624/upy-np0x7r-mv-100-to-630v-9-16624629.pdf?src-supplier=Avnet+Europe; ComponentLink4Description: https://datasheet.ciiva.com/16624/upy-np0x7r-mv-100-to-630v-9-16624629.pdf?src-supplier=Avnet+Europe; ComponentLink5URL: https://datasheet.ciiva.com/11466/upy-np0x7r-mv-100-to-630v-9-11466717.pdf?src-supplier=Avnet; ComponentLink5Description: https://datasheet.ciiva.com/11466/upy-np0x7r-mv-100-to-630v-9-11466717.pdf?src-supplier=Avnet; Supplier Part Number 1: 311-1985-1-ND
C3 = EEE-HB1E330AP: CAP ALUM 33UF 20% 25V SMD; Manufacturer: Panasonic; Ripple Current: 65mA; Life (Hours): 2000Hour; Leakage Current: 3uA; Supplier 1: Digi-Key; Manufacturer Part Number: EEE-HB1E330AP; RoHS: Yes; Category: Aluminum Electrolytic Capacitors; Stock 1: 27; Pricing 1: 1=0.52000, 10=0.35900, 50=0.25160, 100=0.21560, 500=0.16172 (USD); Mount: Surface Mount; Case/Package: Radial; Min Operating Temperature: -40°C; Max Operating Temperature: 105°C; Capacitance: 33uF; Tolerance: 20%; Voltage Rating: 25V; Packaging: Tape and Reel; Package Quantity: 1; Voltage Rating (DC): 25V; Termination: SMD/SMT; Voltage: 25V; Series: HB; Construction: Cylindrical; Diameter: 6.3mm; Length: 6.1mm; Height: 5.8mm; Height - Seated (Max): 0.228inch; Radiation Hardening: No; Lead Free: Lead Free; RoHS Compliant: Yes; ComponentLink1URL: https://datasheet.ciiva.com/11780/0900766b80bed47d-11780811.pdf?src-supplier=RSComponents; ComponentLink1Description: https://datasheet.ciiva.com/11780/0900766b80bed47d-11780811.pdf?src-supplier=RSComponents; ComponentLink2URL: https://datasheet.ciiva.com/2985/aba0000ce117-2985840.pdf?src-supplier=Avnet; ComponentLink2Description: https://datasheet.ciiva.com/2985/aba0000ce117-2985840.pdf?src-supplier=Avnet; ComponentLink3URL: https://datasheet.ciiva.com/17536/aba0000ce117-17536184.pdf?src-supplier=Avnet+Europe; ComponentLink3Description: https://datasheet.ciiva.com/17536/aba0000ce117-17536184.pdf?src-supplier=Avnet+Europe; ComponentLink4URL: https://datasheet.ciiva.com/10331/aba0000ce117-10331117.pdf?src-supplier=Avnet; ComponentLink4Description: https://datasheet.ciiva.com/10331/aba0000ce117-10331117.pdf?src-supplier=Avnet; Supplier Part Number 1: PCE4755CT-ND
C4 C10 = GRM033R61E104KE14D: as C13 on sheet Processing_Section; Supplier 1: Mouser; Manufacturer Part Number: GRM033R61E104KE14D; RoHS: Yes; Category: Ceramic Capacitors; Stock 1: 19728; Pricing 1: 1=0.12000, 10=0.05600, 50=0.05600, 100=0.02500, 1000=0.01400, 10000=0.01100 (USD); Mount: Surface Mount; Case/Package: 0201; Case Code (Metric): 0603; Case Code (Imperial): 0201; Weight: 1.2E-05oz; Min Operating Temperature: -55°C; Max Operating Temperature: 85°C; Packaging: Tape and Reel; Voltage Rating: 25V; Dielectric: X5R; Termination: SMD/SMT; Resistor Type: Ceramic; Voltage Rating (DC): 25V; Package Quantity: 15000; Length: 0.024inch; Width: 0.012inch; Height: 0.3mm; Thickness: 0.013inch; Lead Free: Lead Free; RoHS Compliant: Yes; ComponentLink1URL: http://www.farnell.com/datasheets/2867843.pdf?src-supplier=Farnell; ComponentLink1Description: http://www.farnell.com/datasheets/2867843.pdf?src-supplier=Farnell; ComponentLink2URL: http://www.mouser.com/ds/2/281/c02e-2905.pdf?src-supplier=Mouser; ComponentLink2Description: http://www.mouser.com/ds/2/281/c02e-2905.pdf?src-supplier=Mouser; ComponentLink3URL: http://search.murata.co.jp/Ceramy/image/img/A01X/G101/ENG/GRM033R61E104KE14-01.pdf?src-supplier=Digi-Key; ComponentLink3Description: http://search.murata.co.jp/Ceramy/image/img/A01X/G101/ENG/GRM033R61E104KE14-01.pdf?src-supplier=Digi-Key; ComponentLink4URL: http://www.farnell.com/datasheets/2867843.pdf?src-supplier=Newark; ComponentLink4Description: http://www.farnell.com/datasheets/2867843.pdf?src-supplier=Newark; Supplier Part Number 1: 81-GRM033R61E104KE4D
C5 C11 = C1005X5R1E225KT000E: CAP CER 2.2UF 25V X5R 0402; Manufacturer: TDK; Manufacturer Part Number: C1005X5R1E225K050BC; Dielectric Material: Ceramic; Tolerance: 10%; Supplier 1: Digi-Key; RoHS: Yes; Category: Ceramic Capacitors; Stock 1: 655450; Pricing 1: 1=0.31000, 10=0.21000, 50=0.13980, 100=0.11890, 500=0.08390, 1000=0.07342, 2500=0.06992, 5000=0.06468 (USD); Mount: Surface Mount; Case/Package: 0402; Case Code (Imperial): 0402; Case Code (Metric): 1005; Weight: 2.3E-05oz; Min Operating Temperature: -55°C; Max Operating Temperature: 85°C; Capacitance: 2.2uF; Voltage Rating (DC): 25V; Packaging: Tape and Reel; Package Quantity: 1; Voltage Rating: 25V; Dielectric: X5R; Termination: SMD/SMT; Resistor Type: Ceramic; Series: C; Length: 1mm; Width: 0.5mm; Height: 0.5mm; Thickness: 0.022inch; Depth: 0.5mm; REACH SVHC: No SVHC; Lead Free: Lead Free; RoHS Compliant: Yes; ComponentLink1URL: https://datasheet.ciiva.com/24217/c1005x5r1e225k050bc-264404-24217075.pdf?src-supplier=Mouser; ComponentLink1Description: https://datasheet.ciiva.com/24217/c1005x5r1e225k050bc-264404-24217075.pdf?src-supplier=Mouser; ComponentLink2URL: https://datasheet.ciiva.com/6276/tdkmlcccaprange-6276808.pdf?src-supplier=Digi-Key; ComponentLink2Description: https://datasheet.ciiva.com/6276/tdkmlcccaprange-6276808.pdf?src-supplier=Digi-Key; ComponentLink3URL: https://datasheet.ciiva.com/6276/tdkmlcccaprange-6276806.pdf?src-supplier=Digi-Key; ComponentLink3Description: https://datasheet.ciiva.com/6276/tdkmlcccaprange-6276806.pdf?src-supplier=Digi-Key; ComponentLink4URL: https://datasheet.ciiva.com/6276/tdkmlcccaprange-6276810.pdf?src-supplier=Digi-Key; ComponentLink4Description: https://datasheet.ciiva.com/6276/tdkmlcccaprange-6276810.pdf?src-supplier=Digi-Key; Supplier Part Number 1: 445-9090-1-ND
C6 C8 = C0603X7R221KGT: 50V 220pF X7R ±10% 0201 Multilayer Ceramic Capacitors MLCC - SMD/SMT ROHS; Manufacturer: Darfon Elec; Manufacturer Part No:: C0603X7R221KGT; Value: 220pF; Footprint: 0201; ComponentLink1Description: New link; ComponentLink1URL: https://www.lcsc.com/product-detail/Multilayer-Ceramic-Capacitors-MLCC-SMD-SMT_Darfon-Elec-C0603X7R221KGT_C258475.html
C7 C9 = C1608X5R1E475K080AC: CAP CER 4.7UF 25V X5R 0603; Manufacturer: TDK; Dielectric Material: Ceramic; Tolerance: 10%; Supplier 1: Digi-Key; Manufacturer Part Number: C1608X5R1E475K080AC; RoHS: Yes; Category: Ceramic Capacitors; Stock 1: 495198; Pricing 1: 1=0.36000, 10=0.25000, 50=0.17460, 100=0.14970, 500=0.11230, 1000=0.09483 (USD); Mount: Surface Mount; Case/Package: 0603; Case Code (Metric): 1608; Case Code (Imperial): 0603; Weight: 7.1E-05oz; Min Operating Temperature: -55°C; Max Operating Temperature: 85°C; Termination: SMD/SMT; Packaging: Tape and Reel; Capacitance: 4.7uF; Voltage Rating: 25V; Voltage Rating (DC): 25V; Package Quantity: 4000; Dielectric: X5R; Resistor Type: Ceramic; Length: 1.6mm; Width: 0.031inch; Height: 0.8mm; Thickness: 0.039inch; Depth: 0.8mm; REACH SVHC: No SVHC; Lead Free: Lead Free; ComponentLink1URL: https://datasheet.ciiva.com/48587/6print-detail-pdf-phplangenpart-noc1608x5r1e475k080acimp-unit-xmhz-48587141.pdf?src-supplier=Onlinecomponents.com; ComponentLink1Description: https://datasheet.ciiva.com/48587/6print-detail-pdf-phplangenpart-noc1608x5r1e475k080acimp-unit-xmhz-48587141.pdf?src-supplier=Onlinecomponents.com; ComponentLink2URL: https://datasheet.ciiva.com/24216/mlcc-commercial-general-en-24216326.pdf?src-supplier=Mouser; ComponentLink2Description: https://datasheet.ciiva.com/24216/mlcc-commercial-general-en-24216326.pdf?src-supplier=Mouser; ComponentLink3URL: https://datasheet.ciiva.com/48671/mlcc-commercial-general-en-48671304.pdf?src-supplier=Avnet; ComponentLink3Description: https://datasheet.ciiva.com/48671/mlcc-commercial-general-en-48671304.pdf?src-supplier=Avnet; Supplier Part Number 1: 445-9050-1-ND
D2 D3 = SDM2U20SD3-7: DIODE SCHOTTKY 20V 2A SOD323; Manufacturer: Diodes; Supplier 1: Digi-Key; Manufacturer Part Number: SDM2U20SD3-7; RoHS: Yes; Category: Rectifier Diodes; Stock 1: 6; Pricing 1: 1=0.47000, 10=0.35200, 100=0.19930, 500=0.13200, 1000=0.10120 (USD); Mount: Surface Mount; Packaging: Cut Tape; Average Rectified Current: 2A; Max Reverse Voltage (DC): 20V; RoHS Compliant: Yes; ComponentLink1URL: http://www.mouser.com/ds/2/115/SDM2U20SD3-537776.pdf?src-supplier=Mouser; ComponentLink1Description: http://www.mouser.com/ds/2/115/SDM2U20SD3-537776.pdf?src-supplier=Mouser; ComponentLink2URL: https://www.diodes.com/assets/Datasheets/SDM2U20SD3.pdf?src-supplier=Digi-Key; ComponentLink2Description: https://www.diodes.com/assets/Datasheets/SDM2U20SD3.pdf?src-supplier=Digi-Key; ComponentLink3URL: http://diodes.com/datasheets/SDM2U20SD3.pdf?src-supplier=Avnet; ComponentLink3Description: http://diodes.com/datasheets/SDM2U20SD3.pdf?src-supplier=Avnet; Supplier Part Number 1: SDM2U20SD3-7DICT-ND
L1 L2 = SPM5012T-100M-LR: FIXED IND 10UH 1.3A 390.5MOHM SM; Manufacturer: TDK; Core Material: Metal; Saturation Current: 2.2A; Shielding: Shielded; DC Resistance (DCR): 390.5mR; Test Frequency: 100kHz; Tolerance: 20%; Supplier 1: Digi-Key; Manufacturer Part Number: SPM5012T-100M-LR; RoHS: Yes; Category: Fixed Inductors; Stock 1: 765; Pricing 1: 1=1.50000, 10=1.39400, 25=1.28720, 50=1.07240, 100=1.00820, 250=0.90088, 500=0.77220 (USD); Mount: Surface Mount; Case/Package: Nonstandard; Min Operating Temperature: -40°C; Max Operating Temperature: 125°C; Packaging: Tape and Reel; Resistor Type: Wirewound; Inductance: 10uH; Current Rating: 1.3A; Length: 0.126inch; Width: 0.118inch; Height - Seated (Max): 0.047inch; RoHS Compliant: Yes; ComponentLink1URL: https://product.tdk.com/info/en/catalog/datasheets/inductor_commercial_power_spm5012-lr_en.pdf?src-supplier=Digi-Key; ComponentLink1Description: https://product.tdk.com/info/en/catalog/datasheets/inductor_commercial_power_spm5012-lr_en.pdf?src-supplier=Digi-Key; Supplier Part Number 1: 445-174487-1-ND
R11 R14 = 0201WMF5102TEE: 51kΩ 0201 Chip Resistor; Manufacturer: Uni Royal; Manufacturer Part No:: 0201WMF5102TEE; Value: 51K; Footprint: 0201; ComponentLink1Description: New link; ComponentLink1URL: https://www.lcsc.com/product-detail/Chip-span-style-background-color-ff0-Resistor-span-Surface-Mount_UNI-ROYAL-Uniroyal-Elec-0201WMF5102TEE_C473471.html
R12 R15 = 0201WMF7153TEE: 715kΩ 0201 Chip Resistor; Manufacturer: Uni Royal; Manufacturer Part No:: 0201WMF7153TEE; Footprint: 0201; Value: 715K; ComponentLink1Description: New link; ComponentLink1URL: https://www.lcsc.com/product-detail/Chip-Resistor-Surface-Mount_UNI-ROYAL-Uniroyal-Elec-0201WMF7153TEE_C620454.html
R13 R16 = NQ01WMJ0133TEE: 13kΩ 0201 Chip Resistor; Manufacturer: Uni Royal; Manufacturer Part No:: NQ01WMJ0133TEE; Footprint: 0201; Value: 13K; ComponentLink1Description: New link; ComponentLink1URL: https://lcsc.com/product-detail/Chip-Resistor-Surface-Mount_UNI-ROYAL-Uniroyal-Elec-NQ01WMJ0133TEE_C965341.html
U1 = UA78M05IDCYR: IC REG LINEAR 5V 500MA SOT223-4; Manufacturer: Texas Instruments; Number of Outputs: 1; Min Input Voltage: 7V; Max Input Voltage: 25V; Dropout Voltage: 2V; Polarity: Positive; Quiescent Current: 4.5mA; Output Type: Fixed; Power Supply Rejection Ratio (PSRR): 80dB; Supplier 1: Digi-Key; Manufacturer Part Number: UA78M05IDCYR; RoHS: Yes; Category: Voltage Regulators - Linear; Pricing 1: 1=0.80000, 10=0.70000, 25=0.65720, 100=0.53640, 250=0.49820, 500=0.42400, 1000=0.35000 (USD); Mount: Surface Mount; Case/Package: SOT-223-4; Number of Pins: 4; Weight: 0.006632oz; Min Operating Temperature: -40°C; Max Operating Temperature: 125°C; Output Current: 500mA; Packaging: Tape and Reel; Max Output Current: 500mA; Output Voltage: 5V; Package Quantity: 1; Number of Regulators: 1; Series: -; Nominal Output Voltage: 5V; Lead Free: Lead Free; RoHS Compliant: Yes; REACH SVHC: No SVHC; ComponentLink1URL: https://datasheet.ciiva.com/46429/1849874-46429894.pdf?src-supplier=Element14; ComponentLink1Description: https://datasheet.ciiva.com/46429/1849874-46429894.pdf?src-supplier=Element14; ComponentLink2URL: https://datasheet.ciiva.com/14274/ua78m05-14274743.pdf?src-supplier=Avnet; ComponentLink2Description: https://datasheet.ciiva.com/14274/ua78m05-14274743.pdf?src-supplier=Avnet; ComponentLink3URL: https://datasheet.ciiva.com/2042/ua78m05-2042251.pdf?src-supplier=Digi-Key; ComponentLink3Description: https://datasheet.ciiva.com/2042/ua78m05-2042251.pdf?src-supplier=Digi-Key; ComponentLink4URL: https://datasheet.ciiva.com/2042/ua78m05-2042252.pdf?src-supplier=Digi-Key; ComponentLink4Description: https://datasheet.ciiva.com/2042/ua78m05-2042252.pdf?src-supplier=Digi-Key; ComponentLink5URL: https://datasheet.ciiva.com/2042/ua78m05-2042253.pdf?src-supplier=Digi-Key; ComponentLink5Description: https://datasheet.ciiva.com/2042/ua78m05-2042253.pdf?src-supplier=Digi-Key; Supplier Part Number 1: 296-17616-6-ND
U4 U5 = LMR62014XMF/NOPB: IC REG BOOST ADJ 2A SOT23-5; Manufacturer: TI National Semiconductor; Output Type: Adjustable; Output Configuration: Positive; Switching Frequency: 1.6MHz; Max Output Current: 1.4A; Min Input Voltage: 2.7V; Max Input Voltage: 14V; Number of Outputs: 1; Output Voltage: 20V; Quiescent Current: 2mA; Min Output Voltage: 3V; Synchronous Rectifier: No; Supplier 1: Digi-Key; Manufacturer Part Number: LMR62014XMF/NOPB; RoHS: Yes; Category: Power Supply Modules; Stock 1: 5493; Pricing 1: 1=0.96000, 10=0.86000, 25=0.81600, 100=0.67040, 250=0.62672, 500=0.55384 (USD); Mount: Surface Mount; Case/Package: SOT-23-5; Number of Pins: 5; Contact Plating: Tin,Matte; Min Operating Temperature: -40°C; Max Operating Temperature: 125°C; Output Current: 1.4A; Packaging: Tape and Reel; Package Quantity: 1000; Topology: Boost; Max Output Voltage: 20V; Radiation Hardening: No; REACH SVHC: No SVHC; Lead Free: Lead Free; ComponentLink1URL: https://datasheet.ciiva.com/3231/lmr62014-3231410.pdf?src-supplier=Avnet; ComponentLink1Description: https://datasheet.ciiva.com/3231/lmr62014-3231410.pdf?src-supplier=Avnet; ComponentLink2URL: https://datasheet.ciiva.com/23854/1777788-23854326.pdf?src-supplier=Newark; ComponentLink2Description: https://datasheet.ciiva.com/23854/1777788-23854326.pdf?src-supplier=Newark; ComponentLink3URL: https://datasheet.ciiva.com/4879/snvs735a-74121-4879731.pdf?src-supplier=Mouser; ComponentLink3Description: https://datasheet.ciiva.com/4879/snvs735a-74121-4879731.pdf?src-supplier=Mouser; ComponentLink4URL: https://datasheet.ciiva.com/22669/1716576-22669414.pdf?src-supplier=Element14; ComponentLink4Description: https://datasheet.ciiva.com/22669/1716576-22669414.pdf?src-supplier=Element14; ComponentLink5URL: https://datasheet.ciiva.com/6603/lmr62014-6603804.pdf?src-supplier=Digi-Key; ComponentLink5Description: https://datasheet.ciiva.com/6603/lmr62014-6603804.pdf?src-supplier=Digi-Key; ComponentLink6URL: https://datasheet.ciiva.com/6603/lmr62014-6603807.pdf?src-supplier=Digi-Key; ComponentLink6Description: https://datasheet.ciiva.com/6603/lmr62014-6603807.pdf?src-supplier=Digi-Key; Supplier Part Number 1: LMR62014XMF/NOPBCT-ND

## Nets that join several sheets
BOOST1: Connector_Section (J2.8), Power_Section (C6.1 C7.1 D2.2 R12.2)
BOOST2: Connector_Section (J2.9), Power_Section (C8.1 C9.1 D3.2 R15.2)
FUSE_OUT: Connector_Section (F1.2), Power_Section (10 pins)
GND: Connector_Section (9 pins), Processing_Section (8 pins), Switching_Section (21 pins), Power_Section (15 pins)
VIN#: Connector_Section (C14.1 D1.2 U3.2 U3.3), Processing_Section (R2.2), Power_Section (C3.1 U1.1)
VOUT_5V: Connector_Section (J3.2), Processing_Section (7 pins), Power_Section (C1.1 C2.1 U1.3)
AN_1: Connector_Section (J10.1), Processing_Section (R1.1)
AN_2: Connector_Section (J10.3), Processing_Section (R4.1)
AN_3: Connector_Section (J10.5), Processing_Section (R6.1)
AN_4: Connector_Section (J10.7), Processing_Section (R7.1)
BLUE: Connector_Section (U3.6), Processing_Section (IC1.23)
CAT_1: Connector_Section (J10.2), Processing_Section (U2.2)
CAT_2: Connector_Section (J10.4), Processing_Section (U2.4)
CAT_3: Connector_Section (J10.6), Processing_Section (U2.6)
CAT_4: Connector_Section (J10.8), Processing_Section (U2.8)
FET_1: Connector_Section (J2.5 J2.12), Switching_Section (Q1.3)
FET_2: Connector_Section (J2.6 J2.11), Switching_Section (Q2.3)
FET_3: Connector_Section (J2.7 J2.10), Switching_Section (Q3.3)
GREEN: Connector_Section (U3.5), Processing_Section (IC1.25)
ICSPCLK: Connector_Section (J3.5), Processing_Section (IC1.27)
ICSPDAT: Connector_Section (J3.4), Processing_Section (IC1.28)
RA4: Connector_Section (J11.2), Processing_Section (IC1.6), Switching_Section (C15.1 SW1.1 SW1.2)
RA5: Connector_Section (J11.3), Processing_Section (IC1.7), Switching_Section (C18.1 SW2.1 SW2.2)
RA6: Connector_Section (J11.4), Processing_Section (IC1.9), Switching_Section (C16.1 SW3.1 SW3.2)
RA7: Connector_Section (J11.5), Processing_Section (IC1.10), Switching_Section (C19.1 SW4.1 SW4.2)
RC0: Connector_Section (J11.6), Processing_Section (IC1.11), Switching_Section (C17.1 SW5.1 SW5.2)
RC5: Processing_Section (IC1.16), Switching_Section (Q3.1 R5.2)
RC6: Processing_Section (IC1.17), Switching_Section (Q2.1 R10.2)
RC7: Processing_Section (IC1.18), Switching_Section (Q1.1 R9.2)
RED: Connector_Section (U3.4), Processing_Section (IC1.24)
VPP: Connector_Section (J3.1), Processing_Section (IC1.1 R20.2)
WHITE: Connector_Section (U3.7), Processing_Section (IC1.22)